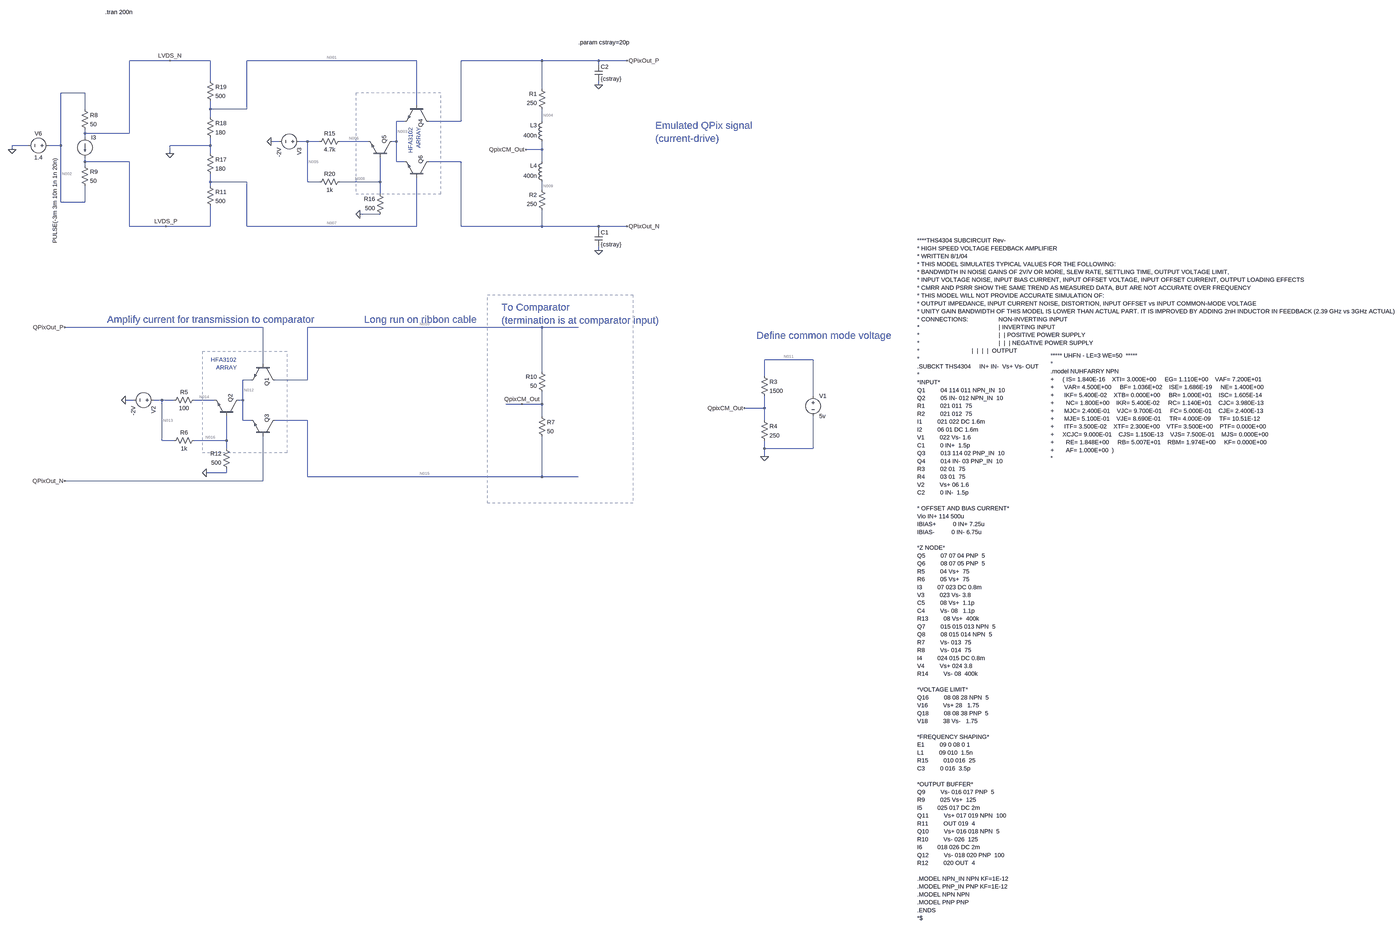
[diagram p0: schematic Qpix_Translator_edits_hfa_sim.asc, whole sheet]
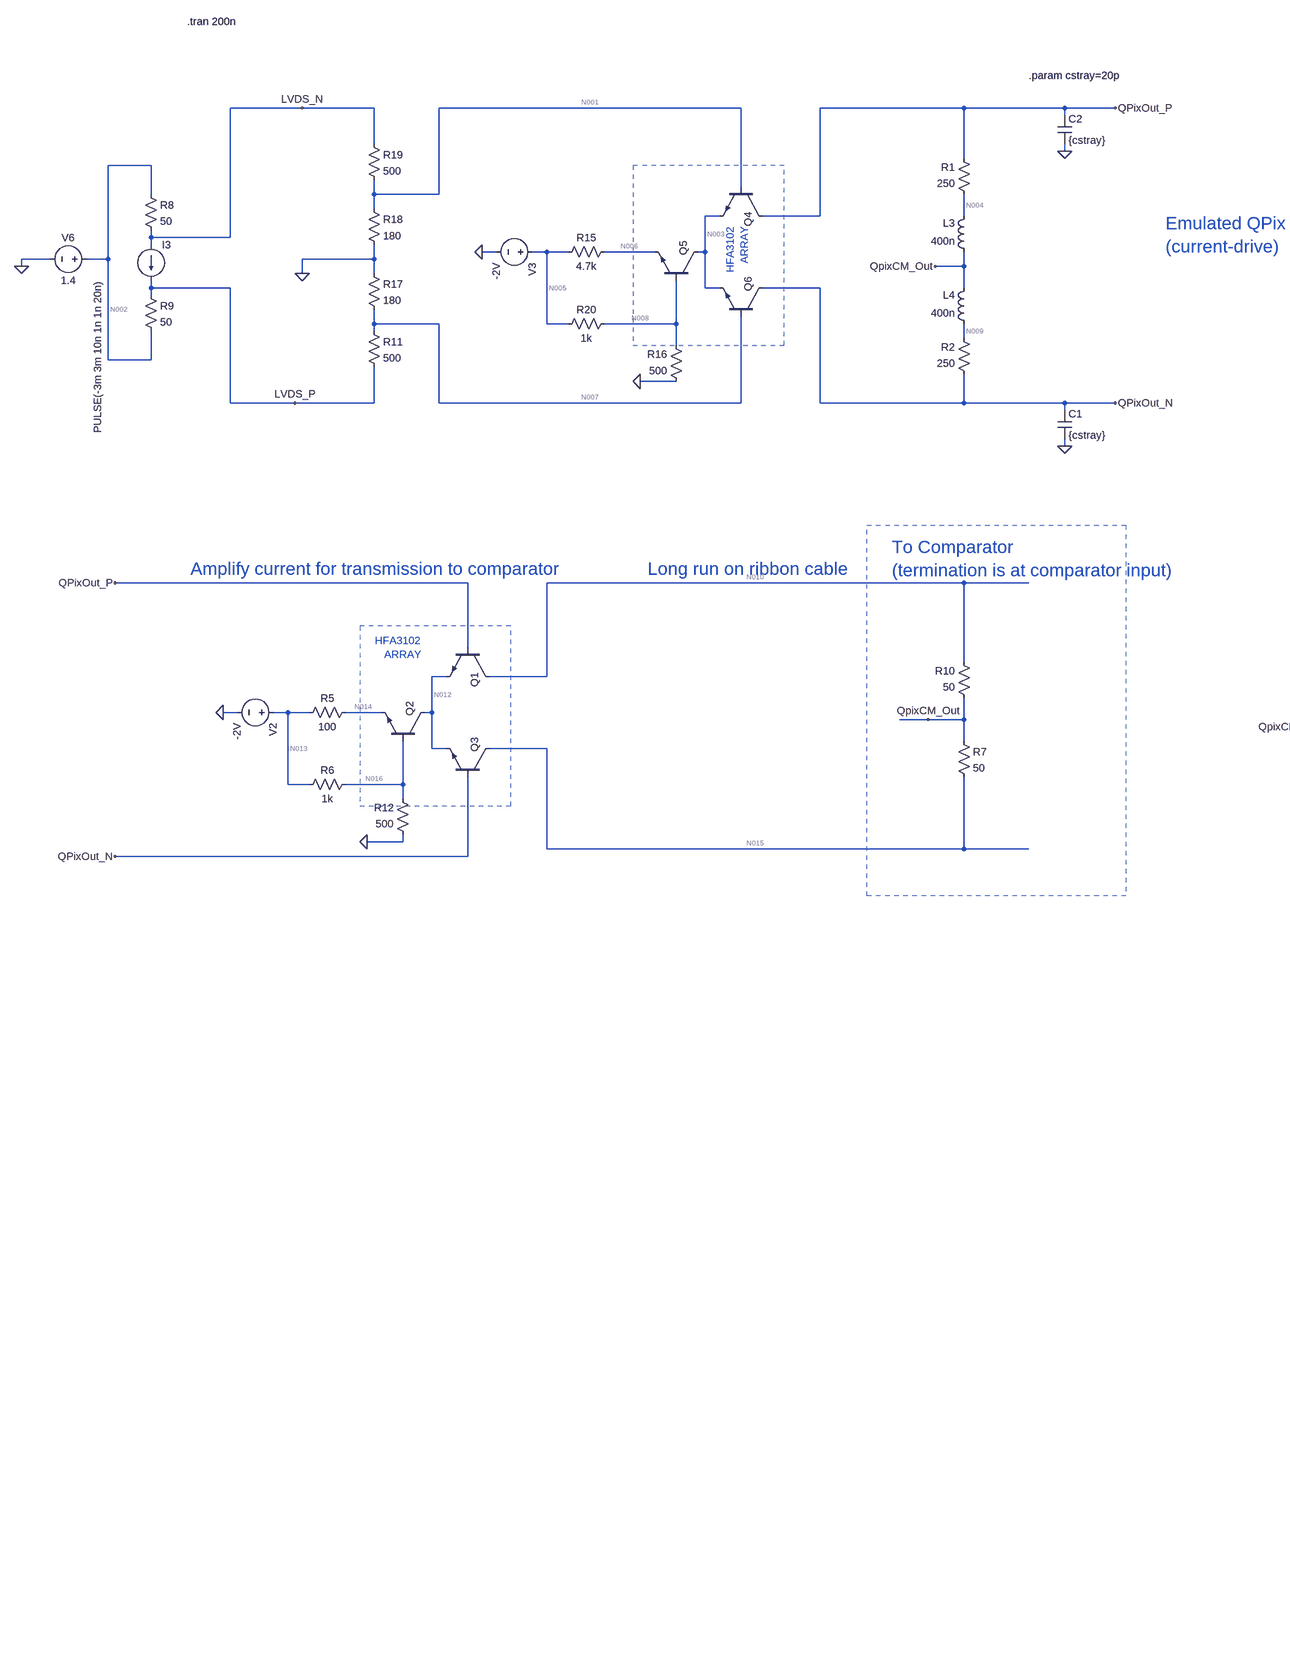
[diagram p1: schematic Qpix_Translator_edits_hfa_sim.asc, part, row 1 of 1, column 1 of 2]
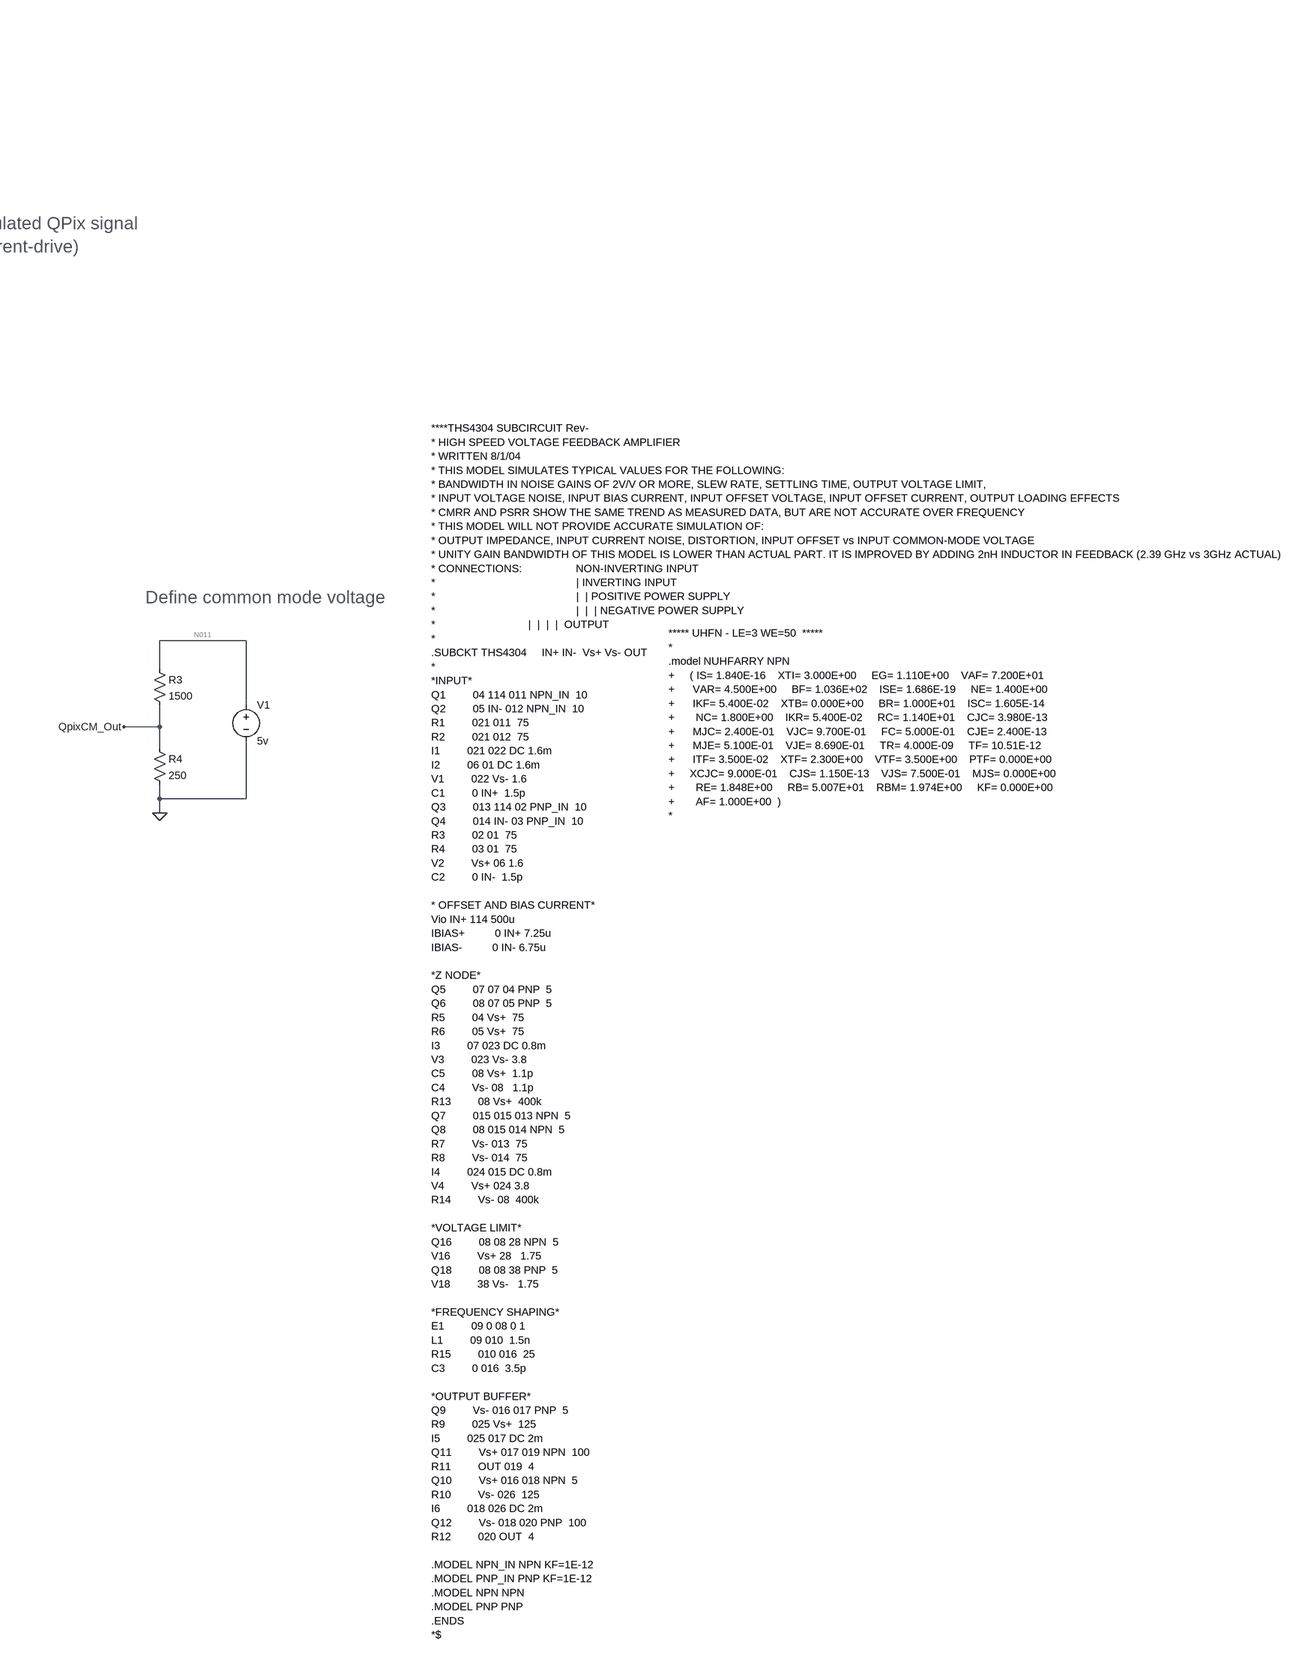
[diagram p2: schematic Qpix_Translator_edits_hfa_sim.asc, part, row 1 of 1, column 2 of 2]
Qpix_Translator_edits_hfa_sim.asc, the LTspice schematic file:
Version 4
SHEET 1 2968 2032
WIRE -4768 -1200 -4928 -1200
WIRE -4608 -1200 -4768 -1200
WIRE -3792 -1200 -4464 -1200
WIRE -3296 -1200 -3616 -1200
WIRE -3072 -1200 -3296 -1200
WIRE -2960 -1200 -3072 -1200
WIRE -3072 -1184 -3072 -1200
WIRE -4608 -1120 -4608 -1200
WIRE -3072 -1104 -3072 -1120
WIRE -3296 -1088 -3296 -1200
WIRE -5104 -1072 -5200 -1072
WIRE -3792 -1024 -3792 -1200
WIRE -5104 -1008 -5104 -1072
WIRE -4608 -1008 -4608 -1040
WIRE -4464 -1008 -4464 -1200
WIRE -4464 -1008 -4608 -1008
WIRE -4608 -976 -4608 -1008
WIRE -3840 -960 -3872 -960
WIRE -3616 -960 -3616 -1200
WIRE -3616 -960 -3744 -960
WIRE -3296 -960 -3296 -1008
WIRE -5104 -912 -5104 -928
WIRE -4928 -912 -4928 -1200
WIRE -4928 -912 -5104 -912
WIRE -5104 -896 -5104 -912
WIRE -4336 -880 -4368 -880
WIRE -4224 -880 -4256 -880
WIRE -4176 -880 -4224 -880
WIRE -3984 -880 -4096 -880
WIRE -3872 -880 -3872 -960
WIRE -3872 -880 -3888 -880
WIRE -5328 -864 -5392 -864
WIRE -5200 -864 -5200 -1072
WIRE -5200 -864 -5248 -864
WIRE -4608 -864 -4608 -896
WIRE -4608 -864 -4768 -864
WIRE -5392 -848 -5392 -864
WIRE -3296 -848 -3296 -880
WIRE -3296 -848 -3360 -848
WIRE -4768 -832 -4768 -864
WIRE -4608 -832 -4608 -864
WIRE -5104 -800 -5104 -816
WIRE -4928 -800 -5104 -800
WIRE -3872 -800 -3872 -880
WIRE -3840 -800 -3872 -800
WIRE -3616 -800 -3744 -800
WIRE -3296 -800 -3296 -848
WIRE -5104 -784 -5104 -800
WIRE -4608 -720 -4608 -752
WIRE -4464 -720 -4608 -720
WIRE -4224 -720 -4224 -880
WIRE -4176 -720 -4224 -720
WIRE -3936 -720 -3936 -816
WIRE -3936 -720 -4096 -720
WIRE -4608 -704 -4608 -720
WIRE -3296 -688 -3296 -720
WIRE -3936 -672 -3936 -720
WIRE -5200 -640 -5200 -864
WIRE -5104 -640 -5104 -704
WIRE -5104 -640 -5200 -640
WIRE -3936 -592 -4016 -592
WIRE -4928 -544 -4928 -800
WIRE -4784 -544 -4928 -544
WIRE -4608 -544 -4608 -624
WIRE -4608 -544 -4784 -544
WIRE -4464 -544 -4464 -720
WIRE -3792 -544 -3792 -736
WIRE -3792 -544 -4464 -544
WIRE -3616 -544 -3616 -800
WIRE -3296 -544 -3296 -608
WIRE -3296 -544 -3616 -544
WIRE -3072 -544 -3296 -544
WIRE -2960 -544 -3072 -544
WIRE -3072 -528 -3072 -544
WIRE -3072 -448 -3072 -464
WIRE -4400 -144 -5184 -144
WIRE -3296 -144 -4224 -144
WIRE -3152 -144 -3296 -144
WIRE -2224 -16 -2416 -16
WIRE -4400 0 -4400 -144
WIRE -3296 32 -3296 -144
WIRE -2416 48 -2416 -16
WIRE -4448 64 -4480 64
WIRE -4224 64 -4224 -144
WIRE -4224 64 -4352 64
WIRE -2224 128 -2224 -16
WIRE -4912 144 -4944 144
WIRE -4800 144 -4832 144
WIRE -4752 144 -4800 144
WIRE -4592 144 -4672 144
WIRE -4480 144 -4480 64
WIRE -4480 144 -4496 144
WIRE -3376 160 -3440 160
WIRE -3296 160 -3296 112
WIRE -3296 160 -3376 160
WIRE -2416 176 -2416 128
WIRE -2416 176 -2496 176
WIRE -3296 208 -3296 160
WIRE -4480 224 -4480 144
WIRE -4448 224 -4480 224
WIRE -4224 224 -4352 224
WIRE -2416 224 -2416 176
WIRE -4800 304 -4800 144
WIRE -4752 304 -4800 304
WIRE -4544 304 -4544 208
WIRE -4544 304 -4672 304
WIRE -4544 336 -4544 304
WIRE -2416 336 -2416 304
WIRE -2224 336 -2224 208
WIRE -2224 336 -2416 336
WIRE -2416 368 -2416 336
WIRE -4544 432 -4544 416
WIRE -4544 432 -4624 432
WIRE -4224 448 -4224 224
WIRE -3296 448 -3296 288
WIRE -3296 448 -4224 448
WIRE -3152 448 -3296 448
WIRE -4400 464 -4400 288
WIRE -4400 464 -5184 464
FLAG -4624 432 0
FLAG -4768 -832 0
FLAG -4768 -1200 LVDS_N
FLAG -4784 -544 LVDS_P
FLAG -5392 -848 0
FLAG -4016 -592 0
FLAG -4368 -880 0
FLAG -3360 -848 QpixCM_Out
FLAG -2416 368 0
FLAG -2496 176 QpixCM_Out
FLAG -2960 -1200 QPixOut_P
FLAG -2960 -544 QPixOut_N
FLAG -5184 -144 QPixOut_P
FLAG -5184 464 QPixOut_N
FLAG -3072 -448 0
FLAG -3072 -1104 0
FLAG -4944 144 0
FLAG -3376 160 QpixCM_Out
SYMBOL res -3280 128 R180
WINDOW 0 36 76 Left 2
WINDOW 3 36 40 Left 2
SYMATTR InstName R10
SYMATTR Value 50
SYMBOL res -3312 192 R0
SYMATTR InstName R7
SYMATTR Value 50
SYMBOL npn -4352 0 R90
SYMATTR InstName Q1
SYMATTR Value ""
SYMATTR SpiceModel NUHFARRY
SYMBOL npn -4496 208 M270
SYMATTR InstName Q2
SYMATTR Value ""
SYMATTR SpiceModel NUHFARRY
SYMBOL npn -4352 288 M270
SYMATTR InstName Q3
SYMATTR Value ""
SYMATTR SpiceModel NUHFARRY
SYMBOL voltage -5232 -864 R90
WINDOW 0 -32 56 VBottom 2
WINDOW 3 32 56 VTop 2
WINDOW 123 0 0 Left 0
WINDOW 39 0 0 Left 0
SYMATTR InstName V6
SYMATTR Value 1.4
SYMBOL current -5104 -896 R0
WINDOW 3 -118 80 VRight 2
WINDOW 123 0 0 Left 0
WINDOW 39 0 0 Left 0
SYMATTR Value PULSE(-3m 3m 10n 1n 1n 20n)
SYMATTR InstName I3
SYMBOL res -5120 -1024 R0
SYMATTR InstName R8
SYMATTR Value 50
SYMBOL res -5120 -800 R0
SYMATTR InstName R9
SYMATTR Value 50
SYMBOL res -4624 -720 R0
SYMATTR InstName R11
SYMATTR Value 500
SYMBOL res -4624 -848 R0
SYMATTR InstName R17
SYMATTR Value 180
SYMBOL res -4624 -992 R0
SYMATTR InstName R18
SYMATTR Value 180
SYMBOL res -4624 -1136 R0
SYMATTR InstName R19
SYMATTR Value 500
SYMBOL npn -3744 -1024 R90
SYMATTR InstName Q4
SYMATTR Value ""
SYMATTR SpiceModel NUHFARRY
SYMBOL npn -3888 -816 M270
SYMATTR InstName Q5
SYMATTR Value ""
SYMATTR SpiceModel NUHFARRY
SYMBOL npn -3744 -736 M270
SYMATTR InstName Q6
SYMATTR Value ""
SYMATTR SpiceModel NUHFARRY
SYMBOL res -4080 -896 R90
WINDOW 0 0 56 VBottom 2
WINDOW 3 32 56 VTop 2
SYMATTR InstName R15
SYMATTR Value 4.7k
SYMBOL res -3920 -576 R180
WINDOW 0 36 76 Left 2
WINDOW 3 36 40 Left 2
SYMATTR InstName R16
SYMATTR Value 500
SYMBOL res -4192 -704 R270
WINDOW 0 32 56 VTop 2
WINDOW 3 0 56 VBottom 2
SYMATTR InstName R20
SYMATTR Value 1k
SYMBOL voltage -4240 -880 R90
WINDOW 123 0 0 Left 0
WINDOW 39 0 0 Left 0
SYMATTR InstName V3
SYMATTR Value -2V
SYMBOL res -3280 -992 R180
WINDOW 0 36 76 Left 2
WINDOW 3 36 40 Left 2
SYMATTR InstName R1
SYMATTR Value 250
SYMBOL res -3280 -592 R180
WINDOW 0 36 76 Left 2
WINDOW 3 36 40 Left 2
SYMATTR InstName R2
SYMATTR Value 250
SYMBOL ind -3280 -864 R180
WINDOW 0 36 80 Left 2
WINDOW 3 36 40 Left 2
SYMATTR InstName L3
SYMATTR Value 400n
SYMBOL ind -3280 -704 R180
WINDOW 0 36 80 Left 2
WINDOW 3 36 40 Left 2
SYMATTR InstName L4
SYMATTR Value 400n
SYMBOL voltage -2224 112 R0
WINDOW 123 0 0 Left 0
WINDOW 39 0 0 Left 0
SYMATTR InstName V1
SYMATTR Value 5v
SYMBOL res -2432 32 R0
SYMATTR InstName R3
SYMATTR Value 1500
SYMBOL res -2432 208 R0
SYMATTR InstName R4
SYMATTR Value 250
SYMBOL cap -3088 -528 R0
SYMATTR InstName C1
SYMATTR Value {cstray}
SYMBOL cap -3088 -1184 R0
SYMATTR InstName C2
SYMATTR Value {cstray}
SYMBOL res -4656 128 R90
WINDOW 0 0 56 VBottom 2
WINDOW 3 32 56 VTop 2
SYMATTR InstName R5
SYMATTR Value 100
SYMBOL res -4768 320 R270
WINDOW 0 32 56 VTop 2
WINDOW 3 0 56 VBottom 2
SYMATTR InstName R6
SYMATTR Value 1k
SYMBOL voltage -4816 144 R90
WINDOW 123 0 0 Left 0
WINDOW 39 0 0 Left 0
SYMATTR InstName V2
SYMATTR Value -2V
SYMBOL res -4528 432 R180
WINDOW 0 36 76 Left 2
WINDOW 3 36 40 Left 2
SYMATTR InstName R12
SYMATTR Value 500
TEXT -5024 -1416 Left 2 !.tran 200n
TEXT -1384 -488 Left 2 !****THS4304 SUBCIRCUIT Rev-\n* HIGH SPEED VOLTAGE FEEDBACK AMPLIFIER  \n* WRITTEN 8/1/04\n* THIS MODEL SIMULATES TYPICAL VALUES FOR THE FOLLOWING:\n* BANDWIDTH IN NOISE GAINS OF 2V/V OR MORE, SLEW RATE, SETTLING TIME, OUTPUT VOLTAGE LIMIT,  \n* INPUT VOLTAGE NOISE, INPUT BIAS CURRENT, INPUT OFFSET VOLTAGE, INPUT OFFSET CURRENT, OUTPUT LOADING EFFECTS\n* CMRR AND PSRR SHOW THE SAME TREND AS MEASURED DATA, BUT ARE NOT ACCURATE OVER FREQUENCY\n* THIS MODEL WILL NOT PROVIDE ACCURATE SIMULATION OF:\n* OUTPUT IMPEDANCE, INPUT CURRENT NOISE, DISTORTION, INPUT OFFSET vs INPUT COMMON-MODE VOLTAGE\n* UNITY GAIN BANDWIDTH OF THIS MODEL IS LOWER THAN ACTUAL PART. IT IS IMPROVED BY ADDING 2nH INDUCTOR IN FEEDBACK (2.39 GHz vs 3GHz ACTUAL)\n* CONNECTIONS:                  NON-INVERTING INPUT\n*                                               | INVERTING INPUT\n*                                               |  | POSITIVE POWER SUPPLY\n*                                               |  |  | NEGATIVE POWER SUPPLY\n*                               |  |  |  |  OUTPUT\n*                               \n.SUBCKT THS4304     IN+ IN-  Vs+ Vs- OUT\n*\n*INPUT*\nQ1         04 114 011 NPN_IN  10\nQ2         05 IN- 012 NPN_IN  10\nR1         021 011  75  \nR2         021 012  75  \nI1         021 022 DC 1.6m  \nI2         06 01 DC 1.6m  \nV1         022 Vs- 1.6\nC1         0 IN+  1.5p  \nQ3         013 114 02 PNP_IN  10\nQ4         014 IN- 03 PNP_IN  10\nR3         02 01  75  \nR4         03 01  75  \nV2         Vs+ 06 1.6\nC2         0 IN-  1.5p  \n \n* OFFSET AND BIAS CURRENT*\nVio IN+ 114 500u\nIBIAS+          0 IN+ 7.25u\nIBIAS-          0 IN- 6.75u\n \n*Z NODE*\nQ5         07 07 04 PNP  5\nQ6         08 07 05 PNP  5\nR5         04 Vs+  75 \nR6         05 Vs+  75  \nI3         07 023 DC 0.8m  \nV3         023 Vs- 3.8\nC5         08 Vs+  1.1p  \nC4         Vs- 08   1.1p  \nR13         08 Vs+  400k  \nQ7         015 015 013 NPN  5\nQ8         08 015 014 NPN  5\nR7         Vs- 013  75  \nR8         Vs- 014  75  \nI4         024 015 DC 0.8m  \nV4         Vs+ 024 3.8\nR14         Vs- 08  400k  \n \n*VOLTAGE LIMIT*\nQ16         08 08 28 NPN  5\nV16         Vs+ 28   1.75 \nQ18         08 08 38 PNP  5\nV18         38 Vs-   1.75  \n \n*FREQUENCY SHAPING* \nE1         09 0 08 0 1\nL1         09 010  1.5n  \nR15         010 016  25  \nC3         0 016  3.5p  \n \n*OUTPUT BUFFER*\nQ9         Vs- 016 017 PNP  5\nR9         025 Vs+  125  \nI5         025 017 DC 2m  \nQ11         Vs+ 017 019 NPN  100\nR11         OUT 019  4  \nQ10         Vs+ 016 018 NPN  5\nR10         Vs- 026  125  \nI6         018 026 DC 2m  \nQ12         Vs- 018 020 PNP  100\nR12         020 OUT  4  \n \n.MODEL NPN_IN NPN KF=1E-12\n.MODEL PNP_IN PNP KF=1E-12\n.MODEL NPN NPN\n.MODEL PNP PNP\n.ENDS\n*$
TEXT -856 -32 Left 2 !***** UHFN - LE=3 WE=50  *****\n*\n.model NUHFARRY NPN\n+     ( IS= 1.840E-16    XTI= 3.000E+00     EG= 1.110E+00    VAF= 7.200E+01\n+      VAR= 4.500E+00     BF= 1.036E+02    ISE= 1.686E-19     NE= 1.400E+00\n+      IKF= 5.400E-02    XTB= 0.000E+00     BR= 1.000E+01    ISC= 1.605E-14\n+       NC= 1.800E+00    IKR= 5.400E-02     RC= 1.140E+01    CJC= 3.980E-13\n+      MJC= 2.400E-01    VJC= 9.700E-01     FC= 5.000E-01    CJE= 2.400E-13\n+      MJE= 5.100E-01    VJE= 8.690E-01     TR= 4.000E-09     TF= 10.51E-12\n+      ITF= 3.500E-02    XTF= 2.300E+00    VTF= 3.500E+00    PTF= 0.000E+00\n+     XCJC= 9.000E-01    CJS= 1.150E-13    VJS= 7.500E-01    MJS= 0.000E+00\n+       RE= 1.848E+00     RB= 5.007E+01    RBM= 1.974E+00     KF= 0.000E+00\n+       AF= 1.000E+00  )\n*
TEXT -3152 -1272 Left 2 !.param cstray=20p
TEXT -4504 -16 Right 2 ;HFA3102\n ARRAY
TEXT -3816 -936 VRight 2 ;HFA3102\n ARRAY
TEXT -2448 -112 Left 4 ;Define common mode voltage
TEXT -3456 -224 Left 4 ;To Comparator\n(termination is at comparator input)
TEXT -5016 -176 Left 4 ;Amplify current for transmission to comparator
TEXT -2848 -944 Left 4 ;Emulated QPix signal\n(current-drive)
TEXT -4000 -176 Left 4 ;Long run on ribbon cable
RECTANGLE Normal -4640 352 -4304 -48 2
RECTANGLE Normal -4032 -672 -3696 -1072 2
RECTANGLE Normal -3512 -272 -2936 552 2

The netlist it stands for:
* Qpix_Translator_edits_hfa_sim.asc
R10 QpixCM_Out N010 50
R7 QpixCM_Out N015 50
Q1 N010 QPixOut_P N012 0 NUHFARRY
Q2 N012 N016 N014 0 NUHFARRY
Q3 N015 QPixOut_N N012 0 NUHFARRY
V6 N002 0 1.4
I3 LVDS_N LVDS_P PULSE(-3m 3m 10n 1n 1n 20n)
R8 N002 LVDS_N 50
R9 LVDS_P N002 50
R11 N007 LVDS_P 500
R17 0 N007 180
R18 N001 0 180
R19 LVDS_N N001 500
Q4 QPixOut_P N001 N003 0 NUHFARRY
Q5 N003 N008 N006 0 NUHFARRY
Q6 QPixOut_N N007 N003 0 NUHFARRY
R15 N006 N005 4.7k
R16 0 N008 500
R20 N005 N008 1k
V3 N005 0 -2V
R1 N004 QPixOut_P 250
R2 QPixOut_N N009 250
L3 QpixCM_Out N004 400n
L4 N009 QpixCM_Out 400n
V1 N011 0 5v
R3 N011 QpixCM_Out 1500
R4 QpixCM_Out 0 250
C1 QPixOut_N 0 {cstray}
C2 QPixOut_P 0 {cstray}
R5 N014 N013 100
R6 N013 N016 1k
V2 N013 0 -2V
R12 0 N016 500
.model NPN NPN
.model PNP PNP
.lib standard.bjt
.tran 200n
****THS4304 SUBCIRCUIT Rev-
* HIGH SPEED VOLTAGE FEEDBACK AMPLIFIER
* WRITTEN 8/1/04
* THIS MODEL SIMULATES TYPICAL VALUES FOR THE FOLLOWING:
* BANDWIDTH IN NOISE GAINS OF 2V/V OR MORE, SLEW RATE, SETTLING TIME, OUTPUT VOLTAGE LIMIT,
* INPUT VOLTAGE NOISE, INPUT BIAS CURRENT, INPUT OFFSET VOLTAGE, INPUT OFFSET CURRENT, OUTPUT LOADING EFFECTS
* CMRR AND PSRR SHOW THE SAME TREND AS MEASURED DATA, BUT ARE NOT ACCURATE OVER FREQUENCY
* THIS MODEL WILL NOT PROVIDE ACCURATE SIMULATION OF:
* OUTPUT IMPEDANCE, INPUT CURRENT NOISE, DISTORTION, INPUT OFFSET vs INPUT COMMON-MODE VOLTAGE
* UNITY GAIN BANDWIDTH OF THIS MODEL IS LOWER THAN ACTUAL PART. IT IS IMPROVED BY ADDING 2nH INDUCTOR IN FEEDBACK (2.39 GHz vs 3GHz ACTUAL)
* CONNECTIONS:                  NON-INVERTING INPUT
*                                               | INVERTING INPUT
*                                               |  | POSITIVE POWER SUPPLY
*                                               |  |  | NEGATIVE POWER SUPPLY
*                               |  |  |  |  OUTPUT
*
.SUBCKT THS4304     IN+ IN-  Vs+ Vs- OUT
*
*INPUT*
Q1         04 114 011 NPN_IN  10
Q2         05 IN- 012 NPN_IN  10
R1         021 011  75
R2         021 012  75
I1         021 022 DC 1.6m
I2         06 01 DC 1.6m
V1         022 Vs- 1.6
C1         0 IN+  1.5p
Q3         013 114 02 PNP_IN  10
Q4         014 IN- 03 PNP_IN  10
R3         02 01  75
R4         03 01  75
V2         Vs+ 06 1.6
C2         0 IN-  1.5p
* OFFSET AND BIAS CURRENT*
Vio IN+ 114 500u
IBIAS+          0 IN+ 7.25u
IBIAS-          0 IN- 6.75u
*Z NODE*
Q5         07 07 04 PNP  5
Q6         08 07 05 PNP  5
R5         04 Vs+  75
R6         05 Vs+  75
I3         07 023 DC 0.8m
V3         023 Vs- 3.8
C5         08 Vs+  1.1p
C4         Vs- 08   1.1p
R13         08 Vs+  400k
Q7         015 015 013 NPN  5
Q8         08 015 014 NPN  5
R7         Vs- 013  75
R8         Vs- 014  75
I4         024 015 DC 0.8m
V4         Vs+ 024 3.8
R14         Vs- 08  400k
*VOLTAGE LIMIT*
Q16         08 08 28 NPN  5
V16         Vs+ 28   1.75
Q18         08 08 38 PNP  5
V18         38 Vs-   1.75
*FREQUENCY SHAPING*
E1         09 0 08 0 1
L1         09 010  1.5n
R15         010 016  25
C3         0 016  3.5p
*OUTPUT BUFFER*
Q9         Vs- 016 017 PNP  5
R9         025 Vs+  125
I5         025 017 DC 2m
Q11         Vs+ 017 019 NPN  100
R11         OUT 019  4
Q10         Vs+ 016 018 NPN  5
R10         Vs- 026  125
I6         018 026 DC 2m
Q12         Vs- 018 020 PNP  100
R12         020 OUT  4
.MODEL NPN_IN NPN KF=1E-12
.MODEL PNP_IN PNP KF=1E-12
.MODEL NPN NPN
.MODEL PNP PNP
.ENDS
*$
***** UHFN - LE=3 WE=50  *****
*
.model NUHFARRY NPN
+     ( IS= 1.840E-16    XTI= 3.000E+00     EG= 1.110E+00    VAF= 7.200E+01
+      VAR= 4.500E+00     BF= 1.036E+02    ISE= 1.686E-19     NE= 1.400E+00
+      IKF= 5.400E-02    XTB= 0.000E+00     BR= 1.000E+01    ISC= 1.605E-14
+       NC= 1.800E+00    IKR= 5.400E-02     RC= 1.140E+01    CJC= 3.980E-13
+      MJC= 2.400E-01    VJC= 9.700E-01     FC= 5.000E-01    CJE= 2.400E-13
+      MJE= 5.100E-01    VJE= 8.690E-01     TR= 4.000E-09     TF= 10.51E-12
+      ITF= 3.500E-02    XTF= 2.300E+00    VTF= 3.500E+00    PTF= 0.000E+00
+     XCJC= 9.000E-01    CJS= 1.150E-13    VJS= 7.500E-01    MJS= 0.000E+00
+       RE= 1.848E+00     RB= 5.007E+01    RBM= 1.974E+00     KF= 0.000E+00
+       AF= 1.000E+00  )
*
.param cstray=20p
* HFA3102
*  ARRAY
* HFA3102
*  ARRAY
* Define common mode voltage
* To Comparator
* (termination is at comparator input)
* Amplify current for transmission to comparator
* Emulated QPix signal
* (current-drive)
* Long run on ribbon cable
.backanno
.end

* Results of the author's LTspice run, read from the files saved beside the schematic
* Operating Point, zero values left out:
*   V(qpixcm_out) = -344.4 mV
*   V(n010) = -448.9 mV
*   V(n015) = -480.2 mV
*   V(qpixout_p) = -365.5 mV
*   V(n012) = -1.154 V
*   V(n016) = -688.1 mV
*   V(n014) = -1.507 V
*   V(qpixout_n) = -356.8 mV
*   V(n002) = 1.4 V
*   V(lvds_n) = 1.443 V
*   V(lvds_p) = 1.164 V
*   V(n007) = 307.8 mV
*   V(n001) = 375 mV
*   V(n003) = -372.7 mV
*   V(n008) = -667.2 mV
*   V(n006) = -1.378 V
*   V(n005) = -2 V
*   V(n004) = -344.4 mV
*   V(n009) = -344.4 mV
*   V(n011) = 5 V
*   V(n013) = -2 V
*   Ic(Q1) = 2.091 mA
*   Ib(Q1) = 25.63 µA
*   Ie(Q1) = -2.116 mA
*   Ic(Q2) = 4.866 mA
*   Ib(Q2) = 64.16 µA
*   Is(Q2) = 1.21 pA
*   Ie(Q2) = -4.93 mA
*   Ic(Q3) = 2.716 mA
*   Ib(Q3) = 33.84 µA
*   Ie(Q3) = -2.75 mA
*   Ic(Q4) = 58.76 µA
*   Ib(Q4) = 53.07 µA
*   Ie(Q4) = -111.8 µA
*   Ic(Q5) = 130.9 µA
*   Ib(Q5) = 1.497 µA
*   Ie(Q5) = -132.4 µA
*   Ic(Q6) = 15.91 µA
*   Ib(Q6) = 3.16 µA
*   Ie(Q6) = -19.07 µA
*   I(L3) = 84.39 µA
*   I(L4) = -49.75 µA
*   I(I3) = -3 mA
*   I(R10) = 2.091 mA
*   I(R7) = 2.716 mA
*   I(R8) = -863.6 µA
*   I(R9) = -4.713 mA
*   I(R11) = -1.713 mA
*   I(R17) = -1.71 mA
*   I(R18) = 2.083 mA
*   I(R19) = 2.136 mA
*   I(R15) = 132.4 µA
*   I(R16) = 1.334 mA
*   I(R20) = -1.333 mA
*   I(R1) = 84.39 µA
*   I(R2) = -49.75 µA
*   I(R3) = 3.563 mA
*   I(R4) = -1.378 mA
*   I(R5) = 4.93 mA
*   I(R6) = -1.312 mA
*   I(R12) = 1.376 mA
*   I(V6) = -3.849 mA
*   I(V3) = 1.465 mA
*   I(V1) = -3.563 mA
*   I(V2) = 6.242 mA
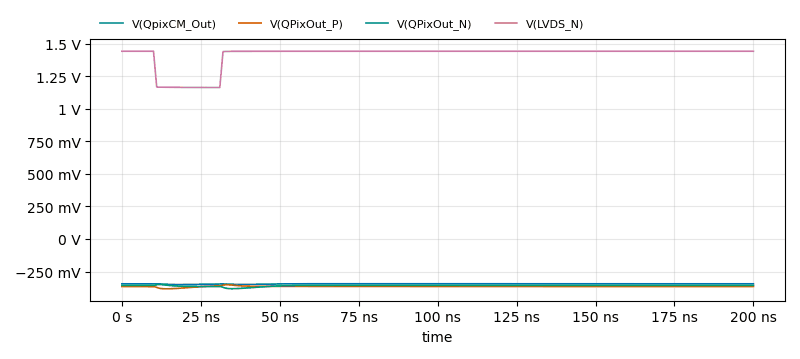
[diagram p3: Transient Analysis of Qpix_Translator_edits_hfa_sim.asc, plotted from the saved traces]
* Transient Analysis, 1 run:
*   V(QpixCM_Out): min -350.5 mV, max -343.9 mV, average -345 mV, rms 345 mV, last -344.4 mV
*   V(QPixOut_P): min -383.1 mV, max -351.3 mV, average -365.5 mV, rms 365.6 mV, last -365.5 mV
*   V(QPixOut_N): min -382.1 mV, max -349.6 mV, average -358.7 mV, rms 358.7 mV, last -356.8 mV
*   V(LVDS_N): min 1.164 V, max 1.443 V, average 1.414 V, rms 1.416 V, last 1.443 V